# Altium schematic sheet Supply.SchDoc
size A4; SheetNumber: 2; SheetTotal: 12; Time: Supply
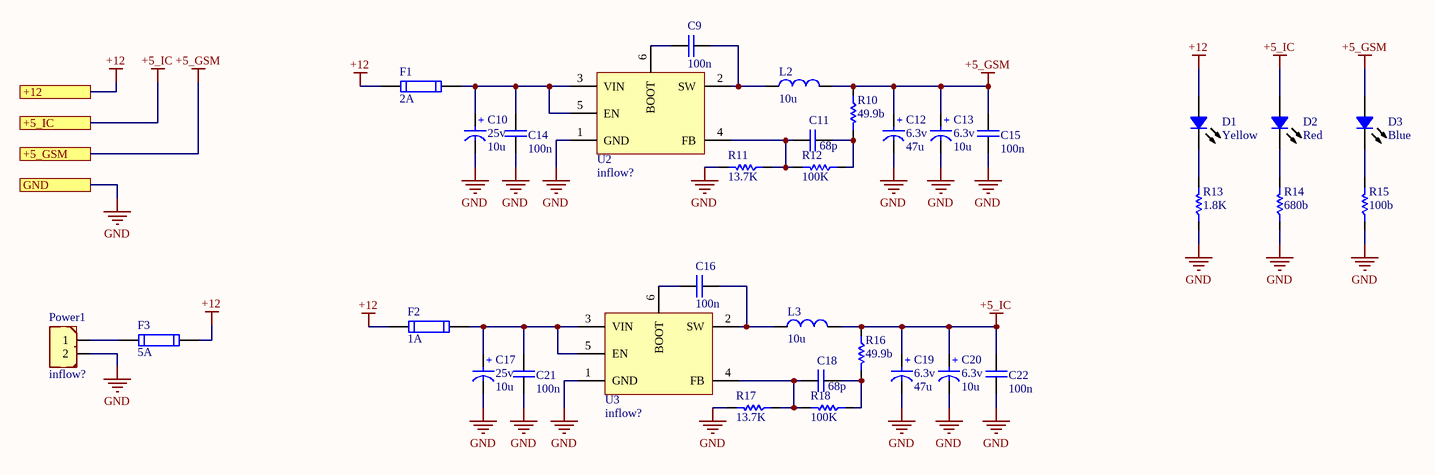
[diagram p0: Supply.SchDoc]

## Parts
C9  100n  [CAP 0805/2012]
C10  Rating: 25v  [SMT_C_Tantalum_B]  (hidden comment: 10u)
C11  68p  [CAP 0805/2012]
C12  Rating: 6.3v  [SMT_C_Tantalum_B]  (hidden comment: 47u)
C13  Rating: 6.3v  [SMT_C_Tantalum_A]  (hidden comment: 10u)
C14  100n  [CAP 1206/3216]
C15  100n  [CAP 1206/3216]
C16  100n  [CAP 0805/2012]
C17  Rating: 25v  [SMT_C_Tantalum_B]  (hidden comment: 10u)
C18  68p  [CAP 0805/2012]
C19  Rating: 6.3v  [SMT_C_Tantalum_B]  (hidden comment: 47u)
C20  Rating: 6.3v  [SMT_C_Tantalum_A]  (hidden comment: 10u)
C21  100n  [CAP 1206/3216]
C22  100n  [CAP 1206/3216]
D1  Yellow  [LED 0805/2012 YELLOW]
D2  Red  [LED 0805/2012 RED]
D3  Blue  [LED 0805/2012 BLUE]
F1  2A  [1206_F]
F2  1A  [1206_F]
F3  5A  [FUSE_BLX_20x5]
L2  10u  [L_7]
L3  10u  [L_7]
Power1  Inflow: inflow?  [Phoenix_2PIN_RA_P5.08mm]  (hidden comment: 2'Pin)
R10  49.9b  [RES 0805 (2012X06L)]
R11  13.7K  [RES 0805 (2012X06L)]
R12  100K  [RES 0805 (2012X06L)]
R13  1.8K  [RES 0805 (2012X06L)]
R14  680b  [RES 0805 (2012X06L)]
R15  100b  [RES 0805 (2012X06L)]
R16  49.9b  [RES 0805 (2012X06L)]
R17  13.7K  [RES 0805 (2012X06L)]
R18  100K  [RES 0805 (2012X06L)]
U2  Inflow: inflow?  [TPS54302]  (hidden comment: Value?)
U3  Inflow: inflow?  [TPS54302]  (hidden comment: Value?)

## Ports
+5_GSM, +5_IC, +12, GND

## Nets
+5_GSM: C12.1(+) C13.1(+) C15.1 D3.1 L2.2 R10.1 ; port +5_GSM
+5_IC: C19.1(+) C20.1(+) C22.1 D2.1 L3.2 R16.1 ; port +5_IC
+12: D1.1 F1.1 F2.1 F3.2 ; port +12
GND: C10.2(-) C12.2(-) C13.2(-) C14.2 C15.2 C17.2(-) C19.2(-) C20.2(-) C21.2 C22.2 Power1.2 R11.2 R13.1 R14.1 R15.1 R17.2 U2.1(GND) U3.1(GND) ; port GND
NetC9_1: C9.1 U2.6(BOOT)
NetC9_2: C9.2 L2.1 U2.2(SW)
NetC10_1: C10.1(+) C14.1 F1.2 U2.3(VIN) U2.5(EN)
NetC11_1: C11.1 R11.1 R12.2 U2.4(FB)
NetC11_2: C11.2 R10.2 R12.1
NetC16_1: C16.1 U3.6(BOOT)
NetC16_2: C16.2 L3.1 U3.2(SW)
NetC17_1: C17.1(+) C21.1 F2.2 U3.3(VIN) U3.5(EN)
NetC18_1: C18.1 R17.1 R18.2 U3.4(FB)
NetC18_2: C18.2 R16.2 R18.1
NetD1_2: D1.2 R13.2
NetD2_2: D2.2 R14.2
NetD3_2: D3.2 R15.2
NetF3_1: F3.1 Power1.1

## Notes on the sheet
- Title:
- Project:
- Drawn by:
- Revision:
- Hossein Bagheri
- Company:
- Sheet
- of

## Library data of the parts
C9 C16 = Cap_Multi_SMD_100nF_0805: Bipolar ceramic capacitor SMD; Inflow: inflow?; Type: MultiLayer; Rating: 50V; Validation: Valid; Package: 0805; Value: 100n
C10 C12 C13 C17 C19 C20 = Cap_Tantalum: Tantalum Capacitor,TAJ Series-SMD; Inflow: inflow?; Validation: Valid; Package: Package?; Type: Tantalum
  C10 C13 C17 C20: Value: 10u
  C12 C19: Value: 47u
C11 C18 = Cap_Multi_SMD_0805: Bipolar ceramic capacitor SMD; Inflow: inflow?; Type: MultiLayer; Rating: Rating?; Validation: Valid; Package: 0805; Value: 68p
C14 C15 C21 C22 = Cap_Multi_SMD_100nF_1206: Bipolar ceramic capacitor SMD; Type: MultiLayer; Inflow: inflow?; Rating: 50V; Validation: Valid; Package: 1206; Value: 100n
D1-D3 = Semi_LED_SMD: LED; Inflow: inflow?; Rating: Rating?; Validation: Valid; Package: Package?; Type: LED
  D1: Value: Yellow
  D2: Value: Red
  D3: Value: Blue
F1 F2 = Other_Elec_Fuse_SMD: Short circiut  protection; Inflow: inflow?; Type: Fast; Rating: Rating?; Validation: Valid; Package: 1206
  F1: Value: 2A
  F2: Value: 1A
F3 = Other_Elec_Fuse_THT: Short circiut  protection; Type: Type?; Inflow: inflow?; Rating: Rating?; Validation: Valid; Package: Package?; Value: 5A
L2 L3 = Ind_SMD: Inductor; Inflow: inflow?; Type: Type?; Rating: 3.8A; Validation: Valid; Package: Package?; Value: 10u
Power1 = Con_Power_2: Power Connector 2'Pin; Rating: Rating?; Validation: NT; Value: 2'Pin; Package: Package?; Type: Type?
R10-R18 = Res_SMD_0805: Resistor; Inflow: inflow?; Rating: 0.125W; Validation: Valid; Package: 0805
  R10 R16: Type: 1%; Value: 49.9b
  R11 R17: Type: 1%; Value: 13.7K
  R12 R18: Type: 1%; Value: 100K
  R13: Type: 10%; Value: 1.8K
  R14: Type: 10%; Value: 680b
  R15: Type: 10%; Value: 100b
U2 U3 = IC_Reg_TPS54302: 3'A Synchronous Step-Down Converter; Rating: S; Validation: Valid; Value: Value?; Type: Switching; Package: SOT-23-6